# Altium schematic sheet 20_BQ76952.SchDoc
size A3; SheetNumber: 3; SheetTotal: 4
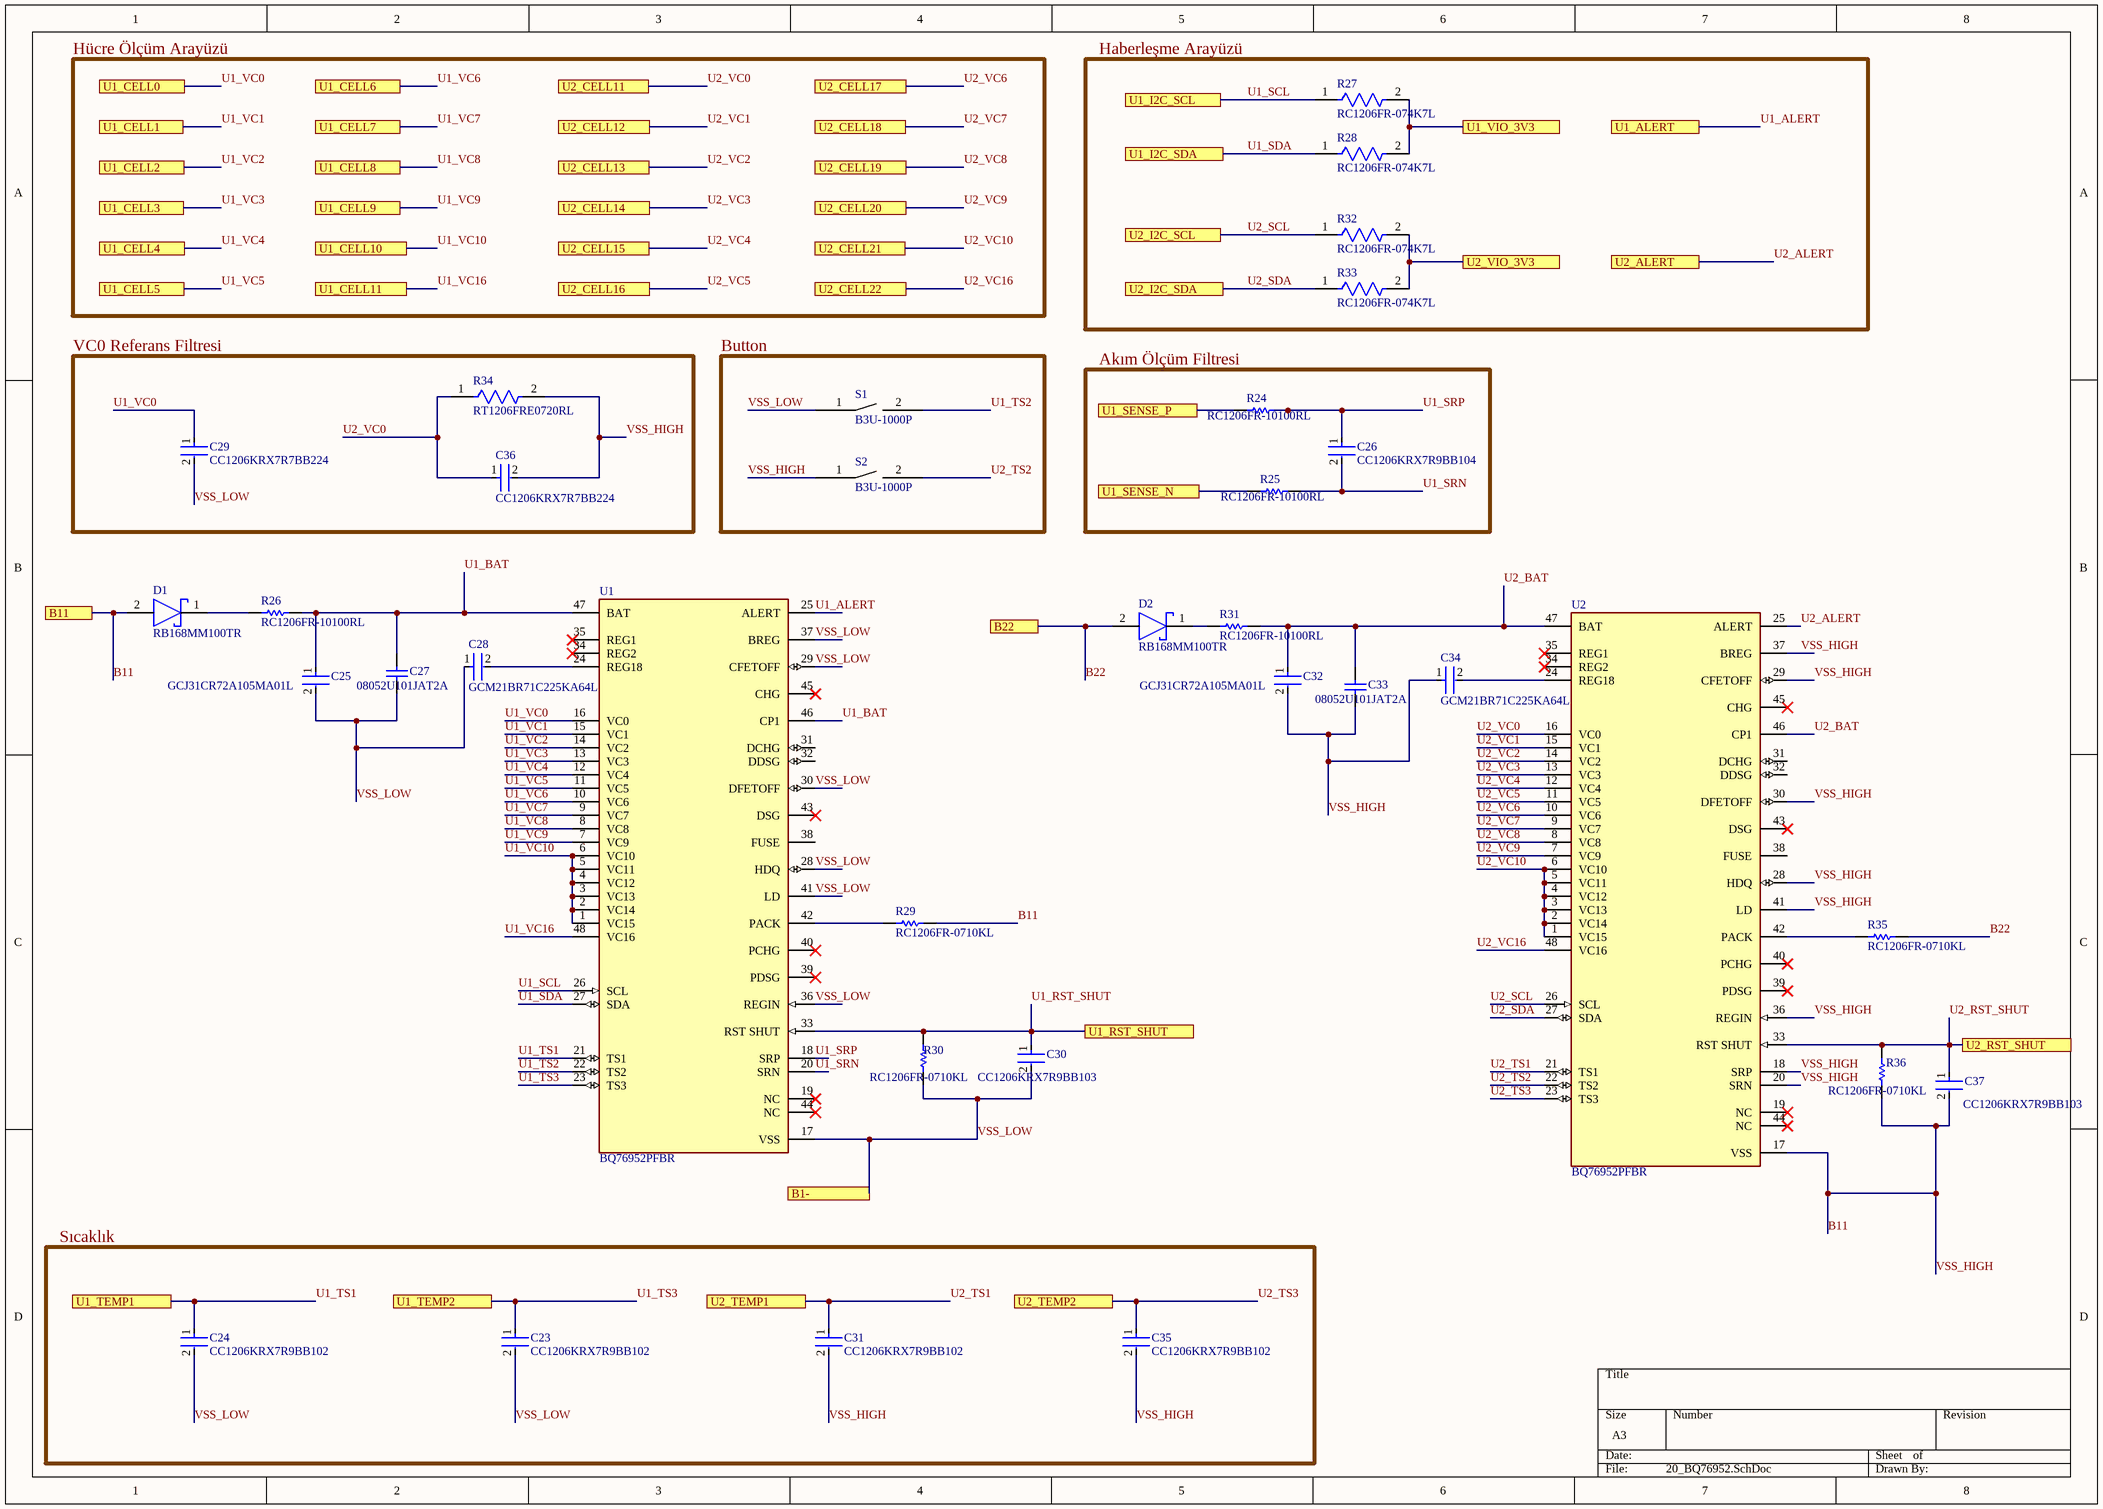
[diagram p0: 20_BQ76952.SchDoc]

## Parts
C23  CC1206KRX7R9BB102  [FP-CC1206-1_25-MFG]
C24  CC1206KRX7R9BB102  [FP-CC1206-1_25-MFG]
C25  GCJ31CR72A105MA01L  [FP-GCJ31C-0_3-IPC_A]
C26  CC1206KRX7R9BB104  [FP-CC1206-1_25-MFG]
C27  08052U101JAT2A  [CAPC2013X115X51ML20T26]
C28  GCM21BR71C225KA64L  [FP-GCM21B-0_15-IPC_B]
C29  CC1206KRX7R7BB224  [FP-CC1206-1_25-MFG]
C30  CC1206KRX7R9BB103  [FP-CC1206-1_25-MFG]
C31  CC1206KRX7R9BB102  [FP-CC1206-1_25-MFG]
C32  GCJ31CR72A105MA01L  [FP-GCJ31C-0_3-IPC_A]
C33  08052U101JAT2A  [CAPC2013X115X51ML20T26]
C34  GCM21BR71C225KA64L  [FP-GCM21B-0_15-IPC_B]
C35  CC1206KRX7R9BB102  [FP-CC1206-1_25-MFG]
C36  CC1206KRX7R7BB224  [FP-CC1206-1_25-MFG]
C37  CC1206KRX7R9BB103  [FP-CC1206-1_25-MFG]
D1  RB168MM100TR  [FP-PMDU-MFG]
D2  RB168MM100TR  [FP-PMDU-MFG]
R24  RC1206FR-10100RL  [RESC3116X65X40NL10T20]
R25  RC1206FR-10100RL  [RESC3116X65X40NL10T20]
R26  RC1206FR-10100RL  [RESC3116X65X40NL10T20]
R27  RC1206FR-074K7L  [FP-RC1206-0_65-IPC_B]
R28  RC1206FR-074K7L  [FP-RC1206-0_65-IPC_B]
R29  RC1206FR-0710KL  [RESC3116X65X40ML10T20]
R30  RC1206FR-0710KL  [RESC3116X65X40ML10T20]
R31  RC1206FR-10100RL  [RESC3116X65X40NL10T20]
R32  RC1206FR-074K7L  [FP-RC1206-0_65-IPC_B]
R33  RC1206FR-074K7L  [FP-RC1206-0_65-IPC_B]
R34  RT1206FRE0720RL  [FP-RT1206-MFG]
R35  RC1206FR-0710KL  [RESC3116X65X40ML10T20]
R36  RC1206FR-0710KL  [RESC3116X65X40ML10T20]
S1  B3U-1000P  [SW_B3U_1000P]
S2  B3U-1000P  [SW_B3U_1000P]
U1  BQ76952PFBR  [FP-PFB0048A-IPC_B]
U2  BQ76952PFBR  [FP-PFB0048A-IPC_B]

## Ports
B1-, B11, B22, U1_ALERT, U1_CELL0, U1_CELL1, U1_CELL2, U1_CELL3, U1_CELL4, U1_CELL5, U1_CELL6, U1_CELL7, U1_CELL8, U1_CELL9, U1_CELL10, U1_CELL11, U1_I2C_SCL, U1_I2C_SDA, U1_RST_SHUT, U1_SENSE_N, U1_SENSE_P, U1_TEMP1, U1_TEMP2, U1_VIO_3V3, U2_ALERT, U2_CELL11, U2_CELL12, U2_CELL13, U2_CELL14, U2_CELL15, U2_CELL16, U2_CELL17, U2_CELL18, U2_CELL19, U2_CELL20, U2_CELL21, U2_CELL22, U2_I2C_SCL, U2_I2C_SDA, U2_RST_SHUT, U2_TEMP1, U2_TEMP2, U2_VIO_3V3

## Nets
B11: C31.2 C32.2 C33.1 C34.1 C35.2 C36.2 C37.2 D1.2(A) R29.2 R34.2 R36.1 S2.1 U2.17(VSS) U2.18(SRP) U2.20(SRN) U2.28(HDQ) U2.29(CFETOFF) U2.30(DFETOFF) U2.36(REGIN) U2.37(BREG) U2.41(LD) ; port B11  [also labelled VSS_HIGH]
B22: D2.2(A) R35.2 ; port B22
U1_ALERT: U1.25(ALERT) ; port U1_ALERT
U1_BAT: C25.1 C27.2 R26.2 U1.46(CP1) U1.47(BAT)
U1_RST_SHUT: C30.1 R30.2 U1.33(RST_SHUT) ; port U1_RST_SHUT
U1_SCL: R27.1 U1.26(SCL) ; port U1_I2C_SCL
U1_SDA: R28.1 U1.27(SDA) ; port U1_I2C_SDA
U1_SENSE_N: R25.1 ; port U1_SENSE_N
U1_SENSE_P: R24.1 ; port U1_SENSE_P
U1_SRN: C26.2 R25.2 U1.20(SRN)
U1_SRP: C26.1 R24.2 U1.18(SRP)
U1_TS1: C24.1 U1.21(TS1) ; port U1_TEMP1
U1_TS2: S1.2 U1.22(TS2)
U1_TS3: C23.1 U1.23(TS3) ; port U1_TEMP2
U1_VC0: C29.1 U1.16(VC0) ; port U1_CELL0
U1_VC1: U1.15(VC1) ; port U1_CELL1
U1_VC2: U1.14(VC2) ; port U1_CELL2
U1_VC3: U1.13(VC3) ; port U1_CELL3
U1_VC4: U1.12(VC4) ; port U1_CELL4
U1_VC5: U1.11(VC5) ; port U1_CELL5
U1_VC6: U1.10(VC6) ; port U1_CELL6
U1_VC7: U1.9(VC7) ; port U1_CELL7
U1_VC8: U1.8(VC8) ; port U1_CELL8
U1_VC9: U1.7(VC9) ; port U1_CELL9
U1_VC10: U1.1(VC15) U1.2(VC14) U1.3(VC13) U1.4(VC12) U1.5(VC11) U1.6(VC10) ; port U1_CELL10
U1_VC16: U1.48(VC16) ; port U1_CELL11
U1_VIO_3V3: R27.2 R28.2 ; port U1_VIO_3V3
U2_ALERT: U2.25(ALERT) ; port U2_ALERT
U2_BAT: C32.1 C33.2 R31.2 U2.46(CP1) U2.47(BAT)
U2_RST_SHUT: C37.1 R36.2 U2.33(RST_SHUT) ; port U2_RST_SHUT
U2_SCL: R32.1 U2.26(SCL) ; port U2_I2C_SCL
U2_SDA: R33.1 U2.27(SDA) ; port U2_I2C_SDA
U2_TS1: C31.1 U2.21(TS1) ; port U2_TEMP1
U2_TS2: S2.2 U2.22(TS2)
U2_TS3: C35.1 U2.23(TS3) ; port U2_TEMP2
U2_VC0: C36.1 R34.1 U2.16(VC0) ; port U2_CELL11
U2_VC1: U2.15(VC1) ; port U2_CELL12
U2_VC2: U2.14(VC2) ; port U2_CELL13
U2_VC3: U2.13(VC3) ; port U2_CELL14
U2_VC4: U2.12(VC4) ; port U2_CELL15
U2_VC5: U2.11(VC5) ; port U2_CELL16
U2_VC6: U2.10(VC6) ; port U2_CELL17
U2_VC7: U2.9(VC7) ; port U2_CELL18
U2_VC8: U2.8(VC8) ; port U2_CELL19
U2_VC9: U2.7(VC9) ; port U2_CELL20
U2_VC10: U2.1(VC15) U2.2(VC14) U2.3(VC13) U2.4(VC12) U2.5(VC11) U2.6(VC10) ; port U2_CELL21
U2_VC16: U2.48(VC16) ; port U2_CELL22
U2_VIO_3V3: R32.2 R33.2 ; port U2_VIO_3V3
VSS_LOW: C23.2 C24.2 C25.2 C27.1 C28.1 C29.2 C30.2 R30.1 S1.1 U1.17(VSS) U1.28(HDQ) U1.29(CFETOFF) U1.30(DFETOFF) U1.36(REGIN) U1.37(BREG) U1.41(LD) ; port B1-
NetC28_2: C28.2 U1.24(REG18)
NetC34_2: C34.2 U2.24(REG18)
NetD1_1: D1.1(C) R26.1
NetD2_1: D2.1(C) R31.1
NetR29_1: R29.1 U1.42(PACK)
NetR35_1: R35.1 U2.42(PACK)

Not connected (* = marked no-connect by the designer): U1 19(NC)* 31(DCHG) 32(DDSG) 34(REG2)* 35(REG1)* 38(FUSE) 39(PDSG)* 40(PCHG)* 43(DSG)* 44(NC)* 45(CHG)*; U2 19(NC)* 31(DCHG) 32(DDSG) 34(REG2)* 35(REG1)* 38(FUSE) 39(PDSG)* 40(PCHG)* 43(DSG)* 44(NC)* 45(CHG)*

## Notes on the sheet
- Labels drawn without touching a wire or pin: Akım Ölçüm Filtresi, Button, Haberleşme Arayüzü, Hücre Ölçüm Arayüzü, Sıcaklık, VC0 Referans Filtresi

## Library data of the parts
C23 C24 C31 C35 = CMP-03422-000488-1: CAP CER 1000PF 50V X7R 1206; Manufacturer: Yageo; Capacitance: 1.0 nF; Temperature Coefficient: 15%; Automotive Grade: NA; Material: Ceramic; Value: 1.0 nF; Tolerance: 0.1; Category: Cap; Temperature Characteristic: X7R; Voltage Rating: 50 V; RoHS: TRUE; Package: CC1206-1.25; Mouser Description: Multilayer Ceramic Capacitors MLCC - SMD/SMT 1000PF 50V 10% 1206; Footprint Url: http://www.yageo.com/exep/pages/download/literatures/UPY-C_GEN_24.pdf; Lead Free: Yes; Digikey Description: CAP CER 1000PF 50V X7R 1206; Device Class L1: Passive Components; ComponentLink2URL: http://www.yageo.com/documents/recent/UPY-NP0X7R_HV_1KV-to-3KV_11.pdf; Temperature Range Low: -55°C; Octopart: https://octopart.com/cc1206krx7r9bb102-yageo-193023; Automotive: No; Height: 1.45mm; Device Class L3: Ceramic Capacitors; ComponentLink2Description: Datasheet; Temperature: -55°C to +125°C; Device Class L2: Capacitors; Manufacturer Part Number: CC1206KRX7R9BB102; Temperature Range High: +125°C
C25 C32 = CMP-06035-003057-1: Cap Ceramic 1uF 100V X7R 20% Pad SMD 1206 Soft Termination  +125°C Automotive T/R
C26 = CMP-03422-000842-1: CAP CER 0.1UF 50V X7R 1206; Manufacturer: Yageo; Automotive Grade: NA; Value: 100 nF; Tolerance: 0.1; Material: Ceramic; Temperature Coefficient: 15%; Temperature Characteristic: X7R; Device Class L1: Passive Components; Lead Free: Yes; Octopart: https://octopart.com/cc1206krx7r9bb104-yageo-39467816; Category: Cap; Temperature Range Low: -55°C; Device Class L3: Ceramic Capacitors; Voltage Rating: 50 V; Temperature Range High: +125°C; Device Class L2: Capacitors; RoHS: TRUE; Package: CC1206-1.25; Footprint Url: http://www.yageo.com/exep/pages/download/literatures/UPY-C_GEN_24.pdf; ComponentLink2Description: Datasheet; Temperature: -55°C to +125°C; Capacitance: 100 nF; Digikey Description: CAP CER 0.1UF 50V X7R 1206; Height: 1.45mm; Automotive: No; Mouser Description: Multilayer Ceramic Capacitors MLCC - SMD/SMT 100nF 50V X7R 10%; ComponentLink2URL: http://www.yageo.com/documents/recent/UPY-NP0X7R_HV_1KV-to-3KV_11.pdf; Manufacturer Part Number: CC1206KRX7R9BB104
C27 C33 = CMP-2007-04861-1: Manufacturer: AVX Interconnect / Elco; Part Number: 08052U101JAT2A
C28 C34 = CMP-2007-03338-2: Ceramic Capacitor for Automotive 2.2uF ±10% 16VDC X7R 0805 Embossed T/R; Voltage: 16V; Case Code (Metric): 2012; Capacitance: 2.2uF; Width: 0.049inch; Package Quantity: 1; Case Code (Imperial): 0805; Packaging: Tape and Reel; Lead Free: Lead Free; Ratings: AEC-Q200; Mount: Surface Mount; Termination: SMD/SMT; Depth: 1.25mm; Tolerance: 10%; Case/Package: 0805; Dielectric: X7R; Length: 2mm; Radiation Hardening: No; REACH SVHC: No SVHC; Voltage Rating (DC): 16V; Voltage Rating: 16V; Height: 1.25mm; Min Operating Temperature: -55°C; Thickness: 0.055inch; Max Operating Temperature: 125°C
C29 C36 = CMP-1037-04366-2: CAP CER 0.22UF 16V X7R 1206; Manufacturer: Yageo; Automotive Grade: NA; Temperature Coefficient: 15%; Tolerance: 0.1; Value: 220 nF; Material: Ceramic; Temperature Range High: +125°C; Device Class L1: Passive Components; Octopart: https://octopart.com/cc1206krx7r7bb224-yageo-42522915; Automotive: No; Package: CC1206-1.25; Digikey Description: CAP CER 0.22UF 16V X7R 1206; RoHS: TRUE; Temperature Range Low: -55°C; Device Class L2: Capacitors; Manufacturer Part Number: CC1206KRX7R7BB224; Height: 1.45mm; Footprint Url: http://www.yageo.com/exep/pages/download/literatures/UPY-C_GEN_24.pdf; Temperature Characteristic: X7R; ComponentLink2URL: http://www.yageo.com/documents/recent/UPY-NP0X7R_HV_1KV-to-3KV_11.pdf; ComponentLink2Description: Datasheet; Mouser Description: Multilayer Ceramic Capacitors MLCC - SMD/SMT 220nF 16V X7R 10%; Voltage Rating: 16 V; Lead Free: Yes; Temperature: -55°C to +125°C; Capacitance: 220 nF; Category: Cap; Device Class L3: Ceramic Capacitors
C30 C37 = CMP-1037-03511-2: CAP CER 10000PF 50V X7R 1206; Manufacturer: Yageo; Automotive Grade: NA; Temperature Coefficient: 15%; Tolerance: 0.1; Capacitance: 10 nF; Value: 10 nF; Material: Ceramic; RoHS: TRUE; Lead Free: Yes; Category: Cap; Temperature Characteristic: X7R; ComponentLink2Description: Datasheet; Device Class L2: Capacitors; Voltage Rating: 50 V; Octopart: https://octopart.com/cc1206krx7r9bb103-yageo-39467800; Temperature Range Low: -55°C; Digikey Description: CAP CER 10000PF 50V X7R 1206; ComponentLink2URL: http://www.yageo.com/documents/recent/UPY-NP0X7R_HV_1KV-to-3KV_11.pdf; Package: CC1206-1.25; Height: 1.45mm; Automotive: No; Mouser Description: Multilayer Ceramic Capacitors MLCC - SMD/SMT 10nF 50V X7R 10%; Temperature Range High: +125°C; Manufacturer Part Number: CC1206KRX7R9BB103; Device Class L3: Ceramic Capacitors; Temperature: -55°C to +125°C; Footprint Url: http://www.yageo.com/exep/pages/download/literatures/UPY-C_GEN_24.pdf; Device Class L1: Passive Components
D1 D2 = CMP-08971-000001-1: DIODE SCHOTTKY 100V 1A SOD123FL; Manufacturer: ROHM Semiconductor; Max Surge Forward Current: 40A; Max Junction Temp: +150°C; Peak Reverse Current: 0.4uA; Reverse Voltage: 100V; Octopart: https://octopart.com/rb168mm100tr-rohm-66788706; Device Class L2: Diodes; Temperature Range High: +150°C; Forward Current: 1A; ComponentLink2URL: https://d1d2qsbl8m0m72.cloudfront.net/en/products/databook/datasheet/discrete/diode/schottky_barrier/rb168mm100tr-e.pdf; Category: Diode; Max Repetitive Reverse Voltage: 100V; RoHS: TRUE; Mouser Description: On a Reel of 3000, ROHM 100V 1A, Schottky Diode, 2-Pin SOD-123FL RB168MM100TR; Package: PMDU; Device Class L3: Schottky Diodes; Manufacturer Part Number: RB168MM100TR; Temperature: to +150°C; Lead Free: Yes; Device Class L1: Discrete Semiconductors; Digikey Description: DIODE SCHOTTKY 100V 1A SOD123FL; Automotive: No; Height: 0.9mm; ComponentLink2Description: Datasheet
R24-R26 R31 = CMP-2003-04959-1: Manufacturer: Yageo; Part Number: RC1206FR-10100RL
R27 R28 R32 R33 = CMP-03412-037805-1: RES SMD 4.7K OHM 1% 1/4W 1206; Max Power Dissipation: 250mW; Voltage Rating: 200V; Temperature Coefficient: 100ppm/°C; Resistance: 4.7kR; Construction: Rectangular; RoHS Compliant: Yes; Max Operating Temperature: 155°C; Tolerance: 1%; Height: 0.026inch; Features: Moisture Resistant; Military Standard: Not; Series: RC; Termination: SMD/SMT; Number of Terminations: 2; Number of Pins: 2; Case Code (Imperial): 1206; Case/Package: 1206; Case Code (Metric): 3216; Voltage Rating (DC): 200V; Width: 0.063inch; Min Operating Temperature: -55°C; Resistance Tolerance: 1%; Length: 0.122inch; Size Code: 1206; Lead Free: Lead Free; Depth: 1.6mm; Packaging: Tape and Reel; Package Quantity: 1; Power Rating: 250mW; Resistor Type: Thick Film
R29 R30 R35 R36 = CMP-1014-00623-2: Chip Resistor, 10 KOhm, +/- 1%, 0.25 W, -55 to 155 degC, 1206 (3216 Metric), RoHS, Tape and Reel; Manufacturer: Yageo; Voltage Rating: 200V; Resistance: 10KOhm; Temperature Coefficient: 100ppm/degreesC; Power Rating: 250mW; Packaging: TapeandReel; Termination: SMD/SMT; REACH SVHC: Unknown; Tolerance: 1%; Height: 0.55mm; Composition: ThickFilm; Max Operating Temperature: 155degC; Datasheet Version: Rev. 5, 10/2016; Lead Free: LeadFree; Case Code (Metric): 3216; Depth: 1.6mm; Package Quantity: 5000; RoHSCompliant: true; Military Standard: Not; Case/Package: 1206; Case Code (Imperial): 1206; Min Operating Temperature: -55degC; Datasheet URL: http://www.yageo.com/NewPortal/yageodocoutput?fileName=/pdf/R-Chip/PYu-RC_Group_51_RoHS_L_5.pdf; Length: 3.1mm; Manufacturer URL: http://www.yageo.com/; Package Reference: 1206.0; Width: 1.6mm; Package Description: 2-Pin Surface Mount Device, Body 3.1 x 1.6 mm
R34 = CMP-2003-04100-2: RES SMD 20 OHM 1% 1/4W 1206; Manufacturer: Yageo; Resistance: 20Ω; Voltage Rating: 200V; Power Rating: 0.25W; Tolerance: 0.0002; Value: 20Ω; Temperature Coefficient: 50 ppm/°C; RoHS: TRUE; Category: Res; Temperature: -55°C to +155°C; Temperature Range High: +155°C; Automotive: No; Package: RT1206; Composition: Thin Film; ComponentLink2URL: http://www.yageo.com/documents/recent/PYu-RT_1-to-0.01_RoHS_L_9.pdf; Series: RT; Device Class L3: Chip SMD Resistors; Digikey Description: RES SMD 20 OHM 1% 1/4W 1206; ComponentLink2Description: Datasheet; Octopart: https://octopart.com/rt1206fre0720rl-yageo-1235386; Footprint Url: http://www.yageo.com/exep/pages/download/literatures/PYu-R_Mount_10.pdf; Manufacturer Part Number: RT1206FRE0720RL; Lead Free: Yes; Device Class L1: Passive Components; Ipc Land Pattern Name: RESC310160X55; Mouser Description: Thin Film Resistors - SMD 1/4W 20 ohm 1% 50ppm; Height: 0.65mm; Device Class L2: Resistors; Temperature Range Low: -55°C
S1 S2 = B3U-1000P: Normally open momentary pushbutton
U1 U2 = CMP-04911-000082-1: IC BAT LIFEPO4/LI-ION 3-16C TQFP; RoHS Compliant: Yes